# Altium schematic sheet Schematic.SchDoc
size A4; SheetNumber: 1; SheetTotal: 1
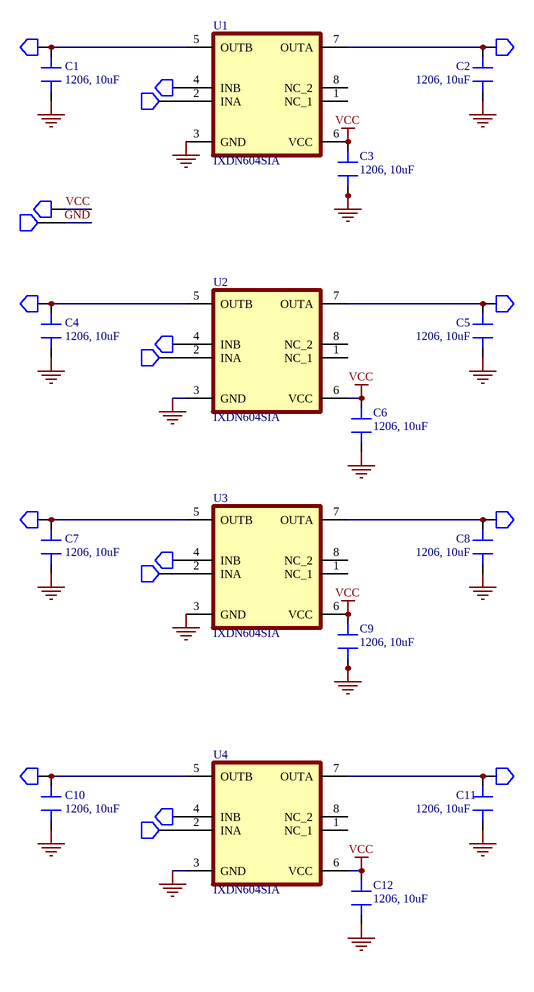
[diagram p0: Schematic.SchDoc]

## Parts
C1  1206, 10uF  [CAP 1206_3216]
C2  1206, 10uF  [CAP 1206_3216]
C3  1206, 10uF  [CAP 1206_3216]
C4  1206, 10uF  [CAP 1206_3216]
C5  1206, 10uF  [CAP 1206_3216]
C6  1206, 10uF  [CAP 1206_3216]
C7  1206, 10uF  [CAP 1206_3216]
C8  1206, 10uF  [CAP 1206_3216]
C9  1206, 10uF  [CAP 1206_3216]
C10  1206, 10uF  [CAP 1206_3216]
C11  1206, 10uF  [CAP 1206_3216]
C12  1206, 10uF  [CAP 1206_3216]
P1  Pad0  [PAD]  (value not drawn)  (no BOM)
P2  Pad0  [PAD]  (value not drawn)  (no BOM)
P3  Pad0  [PAD]  (value not drawn)  (no BOM)
P4  Pad1  [PAD]  (value not drawn)  (no BOM)
P5  Pad0  [PAD]  (value not drawn)  (no BOM)
P6  Pad1  [PAD]  (value not drawn)  (no BOM)
P7  Pad0  [PAD]  (value not drawn)  (no BOM)
P8  Pad0  [PAD]  (value not drawn)  (no BOM)
P9  Pad0  [PAD]  (value not drawn)  (no BOM)
P10  Pad1  [PAD]  (value not drawn)  (no BOM)
P11  Pad0  [PAD]  (value not drawn)  (no BOM)
P12  Pad0  [PAD]  (value not drawn)  (no BOM)
P13  Pad0  [PAD]  (value not drawn)  (no BOM)
P14  Pad1  [PAD]  (value not drawn)  (no BOM)
P17  Pad0  [PAD]  (value not drawn)  (no BOM)
P18  Pad0  [PAD]  (value not drawn)  (no BOM)
P19  Pad0  [PAD]  (value not drawn)  (no BOM)
P20  Pad1  [PAD]  (value not drawn)  (no BOM)
U1  IXDN604SIA  [SOIC127P600X175-8N]
U2  IXDN604SIA  [SOIC127P600X175-8N]
U3  IXDN604SIA  [SOIC127P600X175-8N]
U4  IXDN604SIA  [SOIC127P600X175-8N]

## Nets
GND: C1.1 C2.1 C3.1 C4.1 C5.1 C6.1 C7.1 C8.1 C9.1 C10.1 C11.1 C12.1 P6.1 U1.3(GND) U2.3(GND) U3.3(GND) U4.3(GND)
VCC: C3.2 C6.2 C9.2 C12.2 P5.1 U1.6(VCC) U2.6(VCC) U3.6(VCC) U4.6(VCC)
NetC1_2: C1.2 P1.1 U1.5(OUTB)
NetC2_2: C2.2 P2.1 U1.7(OUTA)
NetC4_2: C4.2 P7.1 U2.5(OUTB)
NetC5_2: C5.2 P8.1 U2.7(OUTA)
NetC7_2: C7.2 P11.1 U3.5(OUTB)
NetC8_2: C8.2 P12.1 U3.7(OUTA)
NetC10_2: C10.2 P17.1 U4.5(OUTB)
NetC11_2: C11.2 P18.1 U4.7(OUTA)
NetP3_1: P3.1 U1.4(INB)
NetP4_1: P4.1 U1.2(INA)
NetP9_1: P9.1 U2.4(INB)
NetP10_1: P10.1 U2.2(INA)
NetP13_1: P13.1 U3.4(INB)
NetP14_1: P14.1 U3.2(INA)
NetP19_1: P19.1 U4.4(INB)
NetP20_1: P20.1 U4.2(INA)

Not connected (* = marked no-connect by the designer): U1 1(NC_1) 8(NC_2); U2 1(NC_1) 8(NC_2); U3 1(NC_1) 8(NC_2); U4 1(NC_1) 8(NC_2)

## Library data of the parts
C1-C12 = 1206 Kapasitör